# Altium schematic sheet motor2.SchDoc
size A3
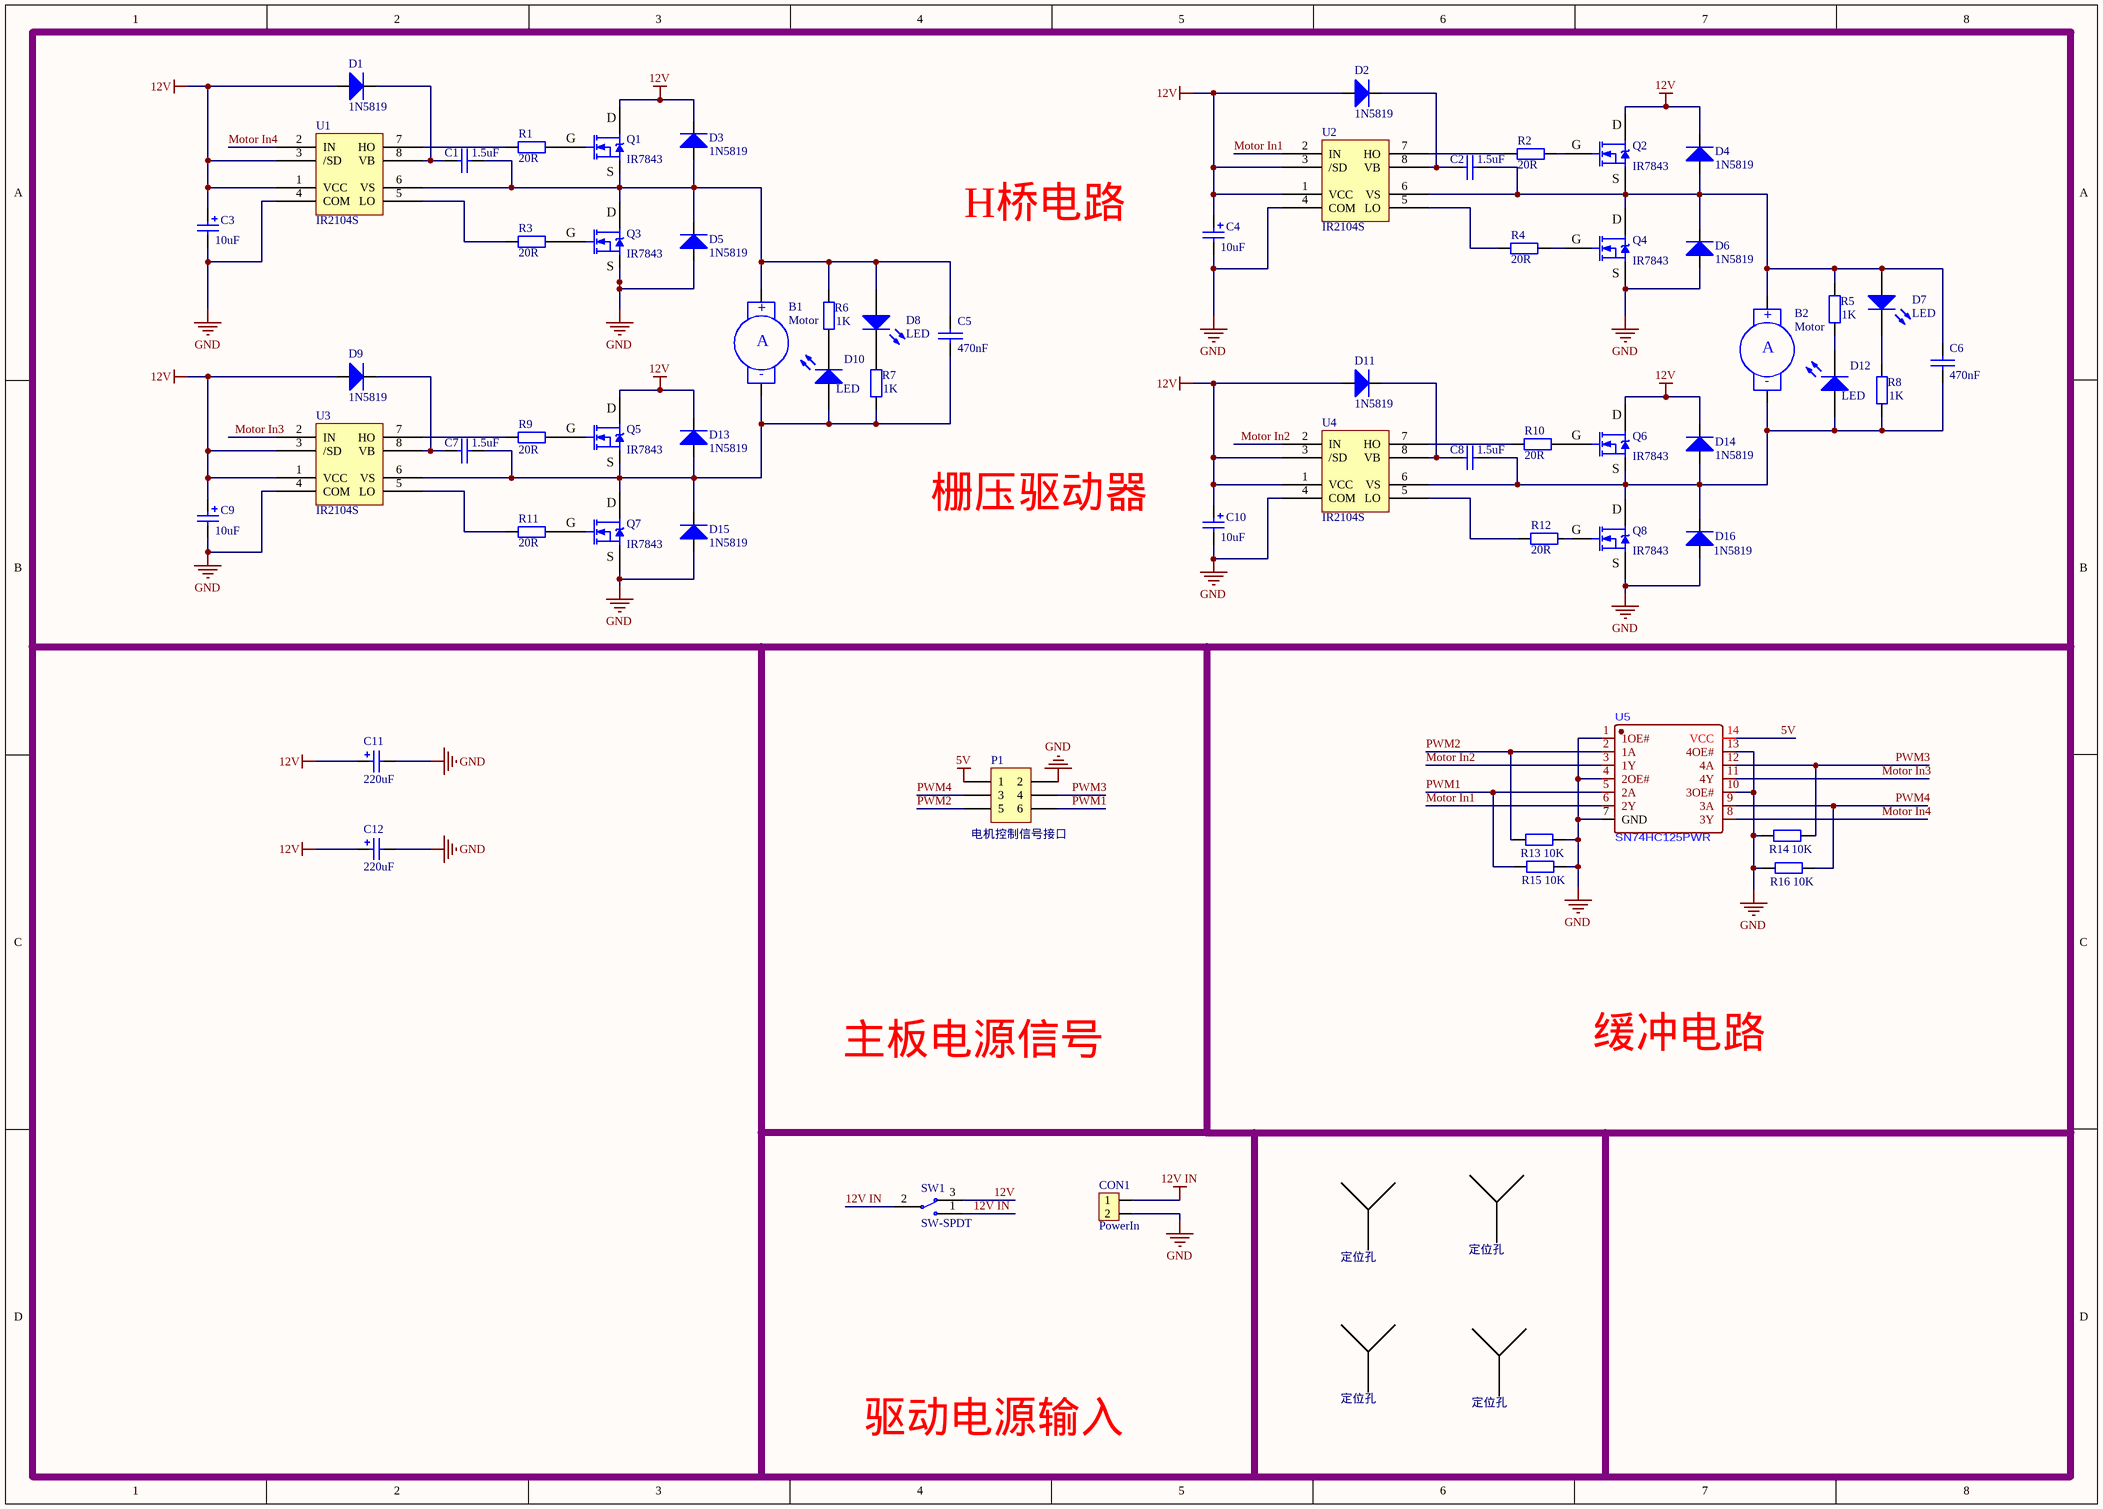
[diagram p0: motor2.SchDoc]

## Parts
*1  定位孔  [M3x7 铜柱+星孔]
*2  定位孔  [M3x7 铜柱+星孔]
*3  定位孔  [M3x7 铜柱+星孔]
*4  定位孔  [M3x7 铜柱+星孔]
B1  Motor  [5.08 2P 螺钉端子]
B2  Motor  [5.08 2P 螺钉端子]
C1  1.5uF  [3216]
C2  1.5uF  [3216]
C3  10uF  [3216]
C4  10uF  [3216]
C5  470nF  [0805 电容 C3]
C6  470nF  [0805 电容 C3]
C7  1.5uF  [3216]
C8  1.5uF  [3216]
C9  10uF  [3216]
C10  10uF  [3216]
C11  220uF  [CAP 3.5*8*11.5 - BK]
C12  220uF  [CAP 3.5*8*11.5 - BK]
CON1  PowerIn  [5.08 2P 螺钉端子]
D1  1N5819  [DO-214  贴片二极管]
D2  1N5819  [DO-214  贴片二极管]
D3  1N5819  [DO-214  贴片二极管]
D4  1N5819  [DO-214  贴片二极管]
D5  1N5819  [DO-214  贴片二极管]
D6  1N5819  [DO-214  贴片二极管]
D7  LED  [0603 LED R]
D8  LED  [0603 LED R]
D9  1N5819  [DO-214  贴片二极管]
D10  LED  [0603 LED R]
D11  1N5819  [DO-214  贴片二极管]
D12  LED  [0603 LED R]
D13  1N5819  [DO-214  贴片二极管]
D14  1N5819  [DO-214  贴片二极管]
D15  1N5819  [DO-214  贴片二极管]
D16  1N5819  [DO-214  贴片二极管]
P1  电机控制信号接口  [MX 1.25-WS-6P]
Q1  IR7843  [TO252]
Q2  IR7843  [TO252]
Q3  IR7843  [TO252]
Q4  IR7843  [TO252]
Q5  IR7843  [TO252]
Q6  IR7843  [TO252]
Q7  IR7843  [TO252]
Q8  IR7843  [TO252]
R1  20R  [0603 电容 C3]
R2  20R  [0603 电容 C3]
R3  20R  [0603 电容 C3]
R4  20R  [0603 电容 C3]
R5  1K  [0603 电容 C3]
R6  1K  [0603 电容 C3]
R7  1K  [0603 电容 C3]
R8  1K  [0603 电容 C3]
R9  20R  [0603 电容 C3]
R10  20R  [0603 电容 C3]
R11  20R  [0603 电容 C3]
R12  20R  [0603 电容 C3]
R13  10K  [0603 电容 C3]
R14  10K  [0603 电容 C3]
R15  10K  [0603 电容 C3]
R16  10K  [0603 电容 C3]
SW1  SW-SPDT  [MTS-102S 两档纽子开关]
U1  IR2104S  [SO8NB]
U2  IR2104S  [SO8NB]
U3  IR2104S  [SO8NB]
U4  IR2104S  [SO8NB]
U5  SN74HC125PWR  [TSSOP14_N]

## Nets
5V: P1.1 U5.14(VCC)
12V: C3.1 C4.1 C9.1 C10.1 C11.1 C12.1 D1.1(A) D2.1(A) D3.2(K) D4.2(K) D9.1(A) D11.1(A) D13.2(K) D14.2(K) Q1.2(D) Q2.2(D) Q5.2(D) Q6.2(D) SW1.3 U1.1(VCC) U1.3(/SD) U2.1(VCC) U2.3(/SD) U3.1(VCC) U3.3(/SD) U4.1(VCC) U4.3(/SD)
12V IN: CON1.1 SW1.1 SW1.2
GND: C3.2 C4.2 C9.2 C10.2 C11.2 C12.2 CON1.2 D5.1(A) D6.1(A) D15.1(A) D16.1(A) P1.2 Q3.3(S) Q4.3(S) Q7.3(S) Q8.3(S) R13.2 R14.1 R15.2 R16.1 U1.4(COM) U2.4(COM) U3.4(COM) U4.4(COM) U5.1(1OE#) U5.4(2OE#) U5.7(GND) U5.10(3OE#) U5.13(4OE#)
Motor In1: U2.2(IN) U5.6(2Y)
Motor In2: U4.2(IN) U5.3(1Y)
Motor In3: U3.2(IN) U5.11(4Y)
Motor In4: U1.2(IN) U5.8(3Y)
PWM1: P1.6 R15.1 U5.5(2A)
PWM2: P1.5 R13.1 U5.2(1A)
PWM3: P1.4 R14.2 U5.12(4A)
PWM4: P1.3 R16.2 U5.9(3A)
NetB1_1: B1.1(+) C1.1 C5.1 D3.1(A) D5.2(K) D8.1(A) Q1.3(S) Q3.2(D) R6.2 U1.6(VS)
NetB1_2: B1.2(-) C5.2 C7.1 D10.1(A) D13.1(A) D15.2(K) Q5.3(S) Q7.2(D) R7.1 U3.6(VS)
NetB2_1: B2.1(+) C2.1 C6.1 D4.1(A) D6.2(K) D7.1(A) Q2.3(S) Q4.2(D) R5.2 U2.6(VS)
NetB2_2: B2.2(-) C6.2 C8.1 D12.1(A) D14.1(A) D16.2(K) Q6.3(S) Q8.2(D) R8.1 U4.6(VS)
NetC1_2: C1.2 D1.2(K) U1.8(VB)
NetC2_2: C2.2 D2.2(K) U2.8(VB)
NetC7_2: C7.2 D9.2(K) U3.8(VB)
NetC8_2: C8.2 D11.2(K) U4.8(VB)
NetD7_2: D7.2(K) R8.2
NetD8_2: D8.2(K) R7.2
NetD10_2: D10.2(K) R6.1
NetD12_2: D12.2(K) R5.1
NetQ1_1: Q1.1(G) R1.2
NetQ2_1: Q2.1(G) R2.2
NetQ3_1: Q3.1(G) R3.2
NetQ4_1: Q4.1(G) R4.2
NetQ5_1: Q5.1(G) R9.2
NetQ6_1: Q6.1(G) R10.2
NetQ7_1: Q7.1(G) R11.2
NetQ8_1: Q8.1(G) R12.2
NetR1_1: R1.1 U1.7(HO)
NetR2_1: R2.1 U2.7(HO)
NetR3_1: R3.1 U1.5(LO)
NetR4_1: R4.1 U2.5(LO)
NetR9_1: R9.1 U3.7(HO)
NetR10_1: R10.1 U4.7(HO)
NetR11_1: R11.1 U3.5(LO)
NetR12_1: R12.1 U4.5(LO)

## Notes on the sheet
- H桥电路
- 栅压驱动器
- 缓冲电路
- 主板电源信号
- 驱动电源输入
- (in symbol Motor Servo) A

## Library data of the parts
B1 B2 = Motor Servo: Servo Motor
C1 C2 C5-C8 = Cap: Capacitor
C3 C4 C9-C12 = Cap Pol1: Polarized Capacitor (Radial); Published: 8-Jun-2000; LatestRevisionDate: 17-Jul-2002; LatestRevisionNote: Re-released for DXP Platform.; PackageReference: RB7.6-15; Publisher: Altium Limited; PackageDescription: Polarized Capacitor (Radial); 2 Leads
  C9 C10: Value: 10uF
CON1 = Header 2: Header, 2-Pin
D1-D6 D9 D11 D13-D16 = Diode: Default Diode; PackageVersion: Sep-1996; PackageDescription: DO-214-AB/SMC; 2 C-Bend Leads; Body 7.9 x 5.9 mm, inc. leads (LxW); Code_JEDEC: DO-214-AB
D7 D8 D10 D12 = LED1: Typical RED GaAs LED; Published: 8-Jun-2000; LatestRevisionDate: 08-Jul-2005; LatestRevisionNote: Mech Layer 1 removed.; PackageReference: LED-1; Publisher: Altium Limited; PackageDescription: LED; 2 Leads
Q1-Q8 = IRF3710: N沟场效应管; 版权归属: 封装库来自淘宝 ID：黄晶宝石; BOM名称: N沟场效应管; 技术支持，联系售后: https://shop463601444.taobao.com
R1-R12 = Res2: Resistor; Published: 8-Jun-2000; LatestRevisionDate: 17-Jul-2002; LatestRevisionNote: Re-released for DXP Platform.; PackageReference: AXIAL-0.4; Publisher: Altium Limited; PackageDescription: Axial Device, Thru-Hole; 2 Leads; 0.4 in Pin Spacing
R13-R16 = R_MPR: 5W无感水泥电阻; BOM名称: 大功率电阻; 版权归属: 封装库来自淘宝 ID：黄晶宝石; 联系售后: https://shop463601444.taobao.com
SW1 = 开关